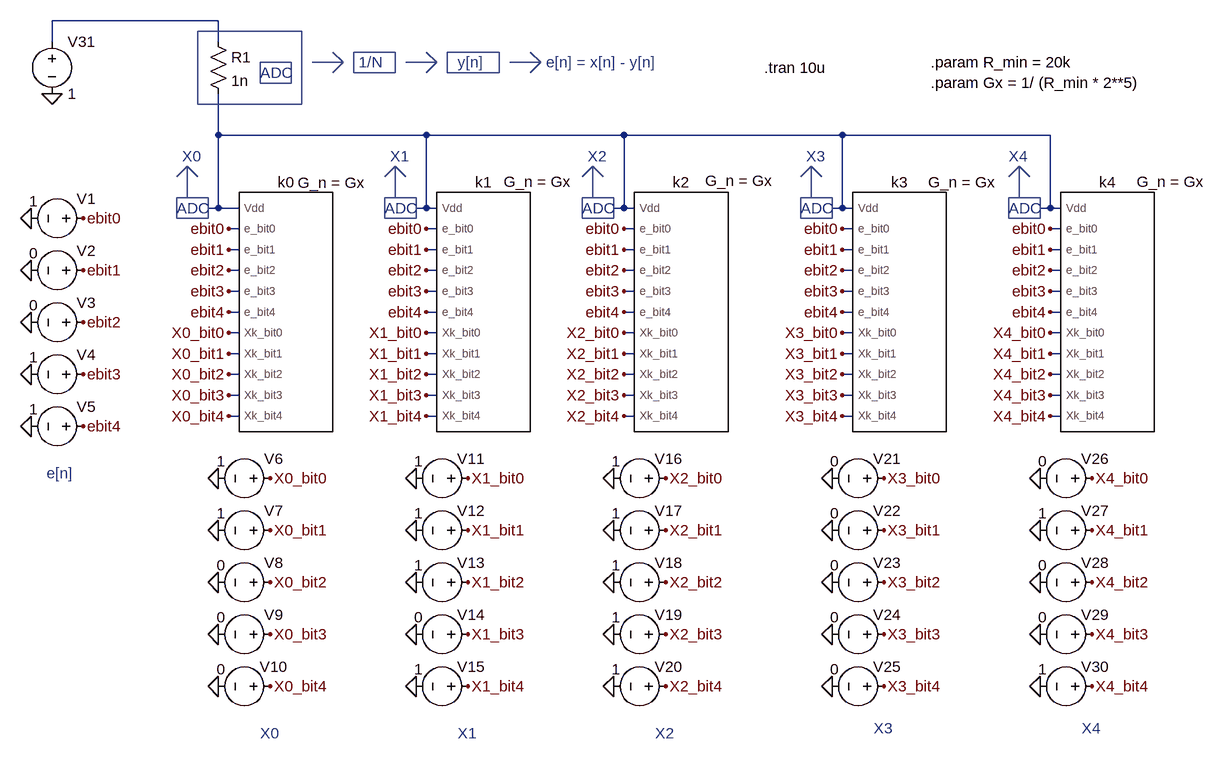
[diagram p0: schematic main.asc]
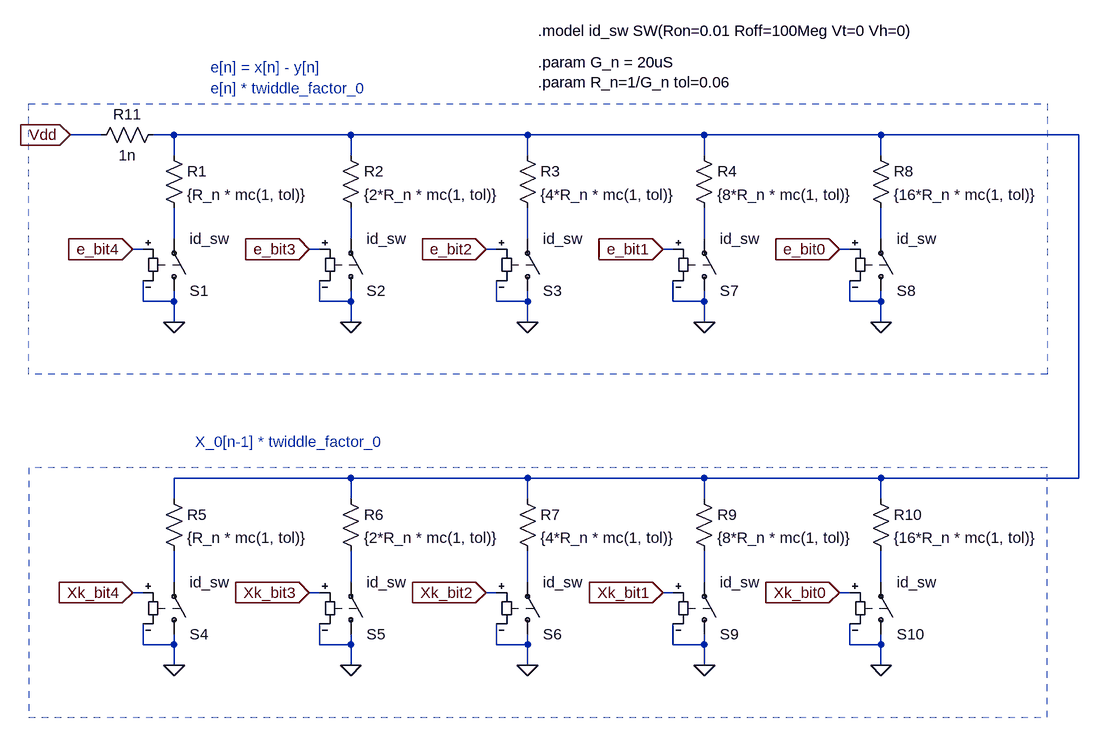
[diagram p1: sub-circuit branch_k.asc]
main.asc, the LTspice schematic file:
Version 4.1
SHEET 1 1732 904
WIRE 176 -208 -80 -208
WIRE -80 -176 -80 -208
WIRE 176 -176 176 -208
WIRE 176 -32 176 -96
WIRE 496 -32 176 -32
WIRE 800 -32 496 -32
WIRE 1136 -32 800 -32
WIRE 1456 -32 1136 -32
WIRE 176 80 176 -32
WIRE 176 80 160 80
WIRE 208 80 176 80
WIRE 496 80 496 -32
WIRE 496 80 480 80
WIRE 512 80 496 80
WIRE 800 80 800 -32
WIRE 800 80 784 80
WIRE 816 80 800 80
WIRE 1136 80 1136 -32
WIRE 1136 80 1120 80
WIRE 1152 80 1136 80
WIRE 1456 80 1456 -32
WIRE 1456 80 1440 80
WIRE 1472 80 1456 80
WIRE 208 112 192 112
WIRE 512 112 496 112
WIRE 816 112 800 112
WIRE 1152 112 1136 112
WIRE 1472 112 1456 112
WIRE 208 144 192 144
WIRE 512 144 496 144
WIRE 816 144 800 144
WIRE 1152 144 1136 144
WIRE 1472 144 1456 144
WIRE 208 176 192 176
WIRE 512 176 496 176
WIRE 816 176 800 176
WIRE 1152 176 1136 176
WIRE 1472 176 1456 176
WIRE 208 208 192 208
WIRE 512 208 496 208
WIRE 816 208 800 208
WIRE 1152 208 1136 208
WIRE 1472 208 1456 208
WIRE 208 240 192 240
WIRE 512 240 496 240
WIRE 816 240 800 240
WIRE 1152 240 1136 240
WIRE 1472 240 1456 240
WIRE 208 272 192 272
WIRE 512 272 496 272
WIRE 816 272 800 272
WIRE 1152 272 1136 272
WIRE 1472 272 1456 272
WIRE 208 304 192 304
WIRE 512 304 496 304
WIRE 816 304 800 304
WIRE 1152 304 1136 304
WIRE 1472 304 1456 304
WIRE 208 336 192 336
WIRE 512 336 496 336
WIRE 816 336 800 336
WIRE 1152 336 1136 336
WIRE 1472 336 1456 336
WIRE 208 368 192 368
WIRE 512 368 496 368
WIRE 816 368 800 368
WIRE 1152 368 1136 368
WIRE 1472 368 1456 368
WIRE 208 400 192 400
WIRE 512 400 496 400
WIRE 816 400 800 400
WIRE 1152 400 1136 400
WIRE 1472 400 1456 400
FLAG -112 96 0
FLAG -112 176 0
FLAG -112 256 0
FLAG -112 336 0
FLAG -112 416 0
FLAG 176 496 0
FLAG 176 576 0
FLAG 176 656 0
FLAG 176 736 0
FLAG 176 816 0
FLAG -32 96 ebit0
FLAG -32 176 ebit1
FLAG -32 256 ebit2
FLAG -32 336 ebit3
FLAG -32 416 ebit4
FLAG 256 496 X0_bit0
FLAG 256 576 X0_bit1
FLAG 256 656 X0_bit2
FLAG 256 736 X0_bit3
FLAG 256 816 X0_bit4
FLAG 480 496 0
FLAG 480 576 0
FLAG 480 656 0
FLAG 480 736 0
FLAG 480 816 0
FLAG 560 496 X1_bit0
FLAG 560 576 X1_bit1
FLAG 560 656 X1_bit2
FLAG 560 736 X1_bit3
FLAG 560 816 X1_bit4
FLAG 784 496 0
FLAG 784 576 0
FLAG 784 656 0
FLAG 784 736 0
FLAG 784 816 0
FLAG 864 496 X2_bit0
FLAG 864 576 X2_bit1
FLAG 864 656 X2_bit2
FLAG 864 736 X2_bit3
FLAG 864 816 X2_bit4
FLAG 1120 496 0
FLAG 1120 576 0
FLAG 1120 656 0
FLAG 1120 736 0
FLAG 1120 816 0
FLAG 1200 496 X3_bit0
FLAG 1200 576 X3_bit1
FLAG 1200 656 X3_bit2
FLAG 1200 736 X3_bit3
FLAG 1200 816 X3_bit4
FLAG 1440 496 0
FLAG 1440 576 0
FLAG 1440 656 0
FLAG 1440 736 0
FLAG 1440 816 0
FLAG 1520 496 X4_bit0
FLAG 1520 576 X4_bit1
FLAG 1520 656 X4_bit2
FLAG 1520 736 X4_bit3
FLAG 1520 816 X4_bit4
FLAG 192 272 X0_bit0
FLAG 192 304 X0_bit1
FLAG 192 336 X0_bit2
FLAG 192 368 X0_bit3
FLAG 192 400 X0_bit4
FLAG 496 272 X1_bit0
FLAG 496 304 X1_bit1
FLAG 496 336 X1_bit2
FLAG 496 368 X1_bit3
FLAG 496 400 X1_bit4
FLAG 800 272 X2_bit0
FLAG 800 304 X2_bit1
FLAG 800 336 X2_bit2
FLAG 800 368 X2_bit3
FLAG 800 400 X2_bit4
FLAG 1136 272 X3_bit0
FLAG 1136 304 X3_bit1
FLAG 1136 336 X3_bit2
FLAG 1136 368 X3_bit3
FLAG 1136 400 X3_bit4
FLAG 1456 272 X4_bit0
FLAG 1456 304 X4_bit1
FLAG 1456 336 X4_bit2
FLAG 1456 368 X4_bit3
FLAG 1456 400 X4_bit4
FLAG 192 112 ebit0
FLAG 192 144 ebit1
FLAG 192 176 ebit2
FLAG 192 208 ebit3
FLAG 192 240 ebit4
FLAG 496 112 ebit0
FLAG 496 144 ebit1
FLAG 496 176 ebit2
FLAG 496 208 ebit3
FLAG 496 240 ebit4
FLAG 800 112 ebit0
FLAG 800 144 ebit1
FLAG 800 176 ebit2
FLAG 800 208 ebit3
FLAG 800 240 ebit4
FLAG 1136 112 ebit0
FLAG 1136 144 ebit1
FLAG 1136 176 ebit2
FLAG 1136 208 ebit3
FLAG 1136 240 ebit4
FLAG 1456 112 ebit0
FLAG 1456 144 ebit1
FLAG 1456 176 ebit2
FLAG 1456 208 ebit3
FLAG 1456 240 ebit4
FLAG -80 -96 0
SYMBOL branch_k 272 240 R0
WINDOW 39 78 -183 Bottom 2
SYMATTR SpiceLine G_n = Gx
SYMATTR InstName k0
SYMBOL branch_k 576 240 R0
WINDOW 39 91 -185 Bottom 2
SYMATTR SpiceLine G_n = Gx
SYMATTR InstName k1
SYMBOL branch_k 880 240 R0
WINDOW 39 97 -186 Bottom 2
SYMATTR SpiceLine G_n = Gx
SYMATTR InstName k2
SYMBOL branch_k 1216 240 R0
WINDOW 39 104 -184 Bottom 2
SYMATTR SpiceLine G_n = Gx
SYMATTR InstName k3
SYMBOL branch_k 1536 240 R0
WINDOW 39 105 -185 Bottom 2
SYMATTR SpiceLine G_n = Gx
SYMATTR InstName k4
SYMBOL voltage -16 96 R90
WINDOW 0 -15 11 VBottom 2
WINDOW 3 -42 92 VTop 2
WINDOW 123 0 0 Left 0
WINDOW 39 0 0 Left 0
SYMATTR InstName V1
SYMATTR Value 1
SYMBOL voltage -16 176 R90
WINDOW 0 -15 11 VBottom 2
WINDOW 3 -42 92 VTop 2
WINDOW 123 0 0 Left 0
WINDOW 39 0 0 Left 0
SYMATTR InstName V2
SYMATTR Value 0
SYMBOL voltage -16 256 R90
WINDOW 0 -15 11 VBottom 2
WINDOW 3 -42 92 VTop 2
WINDOW 123 0 0 Left 0
WINDOW 39 0 0 Left 0
SYMATTR InstName V3
SYMATTR Value 0
SYMBOL voltage -16 336 R90
WINDOW 0 -15 11 VBottom 2
WINDOW 3 -42 92 VTop 2
WINDOW 123 0 0 Left 0
WINDOW 39 0 0 Left 0
SYMATTR InstName V4
SYMATTR Value 1
SYMBOL voltage -16 416 R90
WINDOW 0 -15 11 VBottom 2
WINDOW 3 -42 92 VTop 2
WINDOW 123 0 0 Left 0
WINDOW 39 0 0 Left 0
SYMATTR InstName V5
SYMATTR Value 1
SYMBOL voltage 272 496 R90
WINDOW 0 -15 11 VBottom 2
WINDOW 3 -42 92 VTop 2
WINDOW 123 0 0 Left 0
WINDOW 39 0 0 Left 0
SYMATTR InstName V6
SYMATTR Value 1
SYMBOL voltage 272 576 R90
WINDOW 0 -15 11 VBottom 2
WINDOW 3 -42 92 VTop 2
WINDOW 123 0 0 Left 0
WINDOW 39 0 0 Left 0
SYMATTR InstName V7
SYMATTR Value 1
SYMBOL voltage 272 656 R90
WINDOW 0 -15 11 VBottom 2
WINDOW 3 -42 92 VTop 2
WINDOW 123 0 0 Left 0
WINDOW 39 0 0 Left 0
SYMATTR InstName V8
SYMATTR Value 0
SYMBOL voltage 272 736 R90
WINDOW 0 -15 11 VBottom 2
WINDOW 3 -42 92 VTop 2
WINDOW 123 0 0 Left 0
WINDOW 39 0 0 Left 0
SYMATTR InstName V9
SYMATTR Value 0
SYMBOL voltage 272 816 R90
WINDOW 0 -15 11 VBottom 2
WINDOW 3 -42 92 VTop 2
WINDOW 123 0 0 Left 0
WINDOW 39 0 0 Left 0
SYMATTR InstName V10
SYMATTR Value 0
SYMBOL voltage 576 496 R90
WINDOW 0 -15 11 VBottom 2
WINDOW 3 -42 92 VTop 2
WINDOW 123 0 0 Left 0
WINDOW 39 0 0 Left 0
SYMATTR InstName V11
SYMATTR Value 1
SYMBOL voltage 576 576 R90
WINDOW 0 -15 11 VBottom 2
WINDOW 3 -42 92 VTop 2
WINDOW 123 0 0 Left 0
WINDOW 39 0 0 Left 0
SYMATTR InstName V12
SYMATTR Value 1
SYMBOL voltage 576 656 R90
WINDOW 0 -15 11 VBottom 2
WINDOW 3 -42 92 VTop 2
WINDOW 123 0 0 Left 0
WINDOW 39 0 0 Left 0
SYMATTR InstName V13
SYMATTR Value 1
SYMBOL voltage 576 736 R90
WINDOW 0 -15 11 VBottom 2
WINDOW 3 -42 92 VTop 2
WINDOW 123 0 0 Left 0
WINDOW 39 0 0 Left 0
SYMATTR InstName V14
SYMATTR Value 0
SYMBOL voltage 576 816 R90
WINDOW 0 -15 11 VBottom 2
WINDOW 3 -42 92 VTop 2
WINDOW 123 0 0 Left 0
WINDOW 39 0 0 Left 0
SYMATTR InstName V15
SYMATTR Value 1
SYMBOL voltage 880 496 R90
WINDOW 0 -15 11 VBottom 2
WINDOW 3 -42 92 VTop 2
WINDOW 123 0 0 Left 0
WINDOW 39 0 0 Left 0
SYMATTR InstName V16
SYMATTR Value 1
SYMBOL voltage 880 576 R90
WINDOW 0 -15 11 VBottom 2
WINDOW 3 -42 92 VTop 2
WINDOW 123 0 0 Left 0
WINDOW 39 0 0 Left 0
SYMATTR InstName V17
SYMATTR Value 1
SYMBOL voltage 880 656 R90
WINDOW 0 -15 11 VBottom 2
WINDOW 3 -42 92 VTop 2
WINDOW 123 0 0 Left 0
WINDOW 39 0 0 Left 0
SYMATTR InstName V18
SYMATTR Value 1
SYMBOL voltage 880 736 R90
WINDOW 0 -15 11 VBottom 2
WINDOW 3 -42 92 VTop 2
WINDOW 123 0 0 Left 0
WINDOW 39 0 0 Left 0
SYMATTR InstName V19
SYMATTR Value 1
SYMBOL voltage 880 816 R90
WINDOW 0 -15 11 VBottom 2
WINDOW 3 -42 92 VTop 2
WINDOW 123 0 0 Left 0
WINDOW 39 0 0 Left 0
SYMATTR InstName V20
SYMATTR Value 1
SYMBOL voltage 1216 496 R90
WINDOW 0 -15 11 VBottom 2
WINDOW 3 -42 92 VTop 2
WINDOW 123 0 0 Left 0
WINDOW 39 0 0 Left 0
SYMATTR InstName V21
SYMATTR Value 0
SYMBOL voltage 1216 576 R90
WINDOW 0 -15 11 VBottom 2
WINDOW 3 -42 92 VTop 2
WINDOW 123 0 0 Left 0
WINDOW 39 0 0 Left 0
SYMATTR InstName V22
SYMATTR Value 0
SYMBOL voltage 1216 656 R90
WINDOW 0 -15 11 VBottom 2
WINDOW 3 -42 92 VTop 2
WINDOW 123 0 0 Left 0
WINDOW 39 0 0 Left 0
SYMATTR InstName V23
SYMATTR Value 0
SYMBOL voltage 1216 736 R90
WINDOW 0 -15 11 VBottom 2
WINDOW 3 -42 92 VTop 2
WINDOW 123 0 0 Left 0
WINDOW 39 0 0 Left 0
SYMATTR InstName V24
SYMATTR Value 0
SYMBOL voltage 1216 816 R90
WINDOW 0 -15 11 VBottom 2
WINDOW 3 -42 92 VTop 2
WINDOW 123 0 0 Left 0
WINDOW 39 0 0 Left 0
SYMATTR InstName V25
SYMATTR Value 0
SYMBOL voltage 1536 496 R90
WINDOW 0 -15 11 VBottom 2
WINDOW 3 -42 92 VTop 2
WINDOW 123 0 0 Left 0
WINDOW 39 0 0 Left 0
SYMATTR InstName V26
SYMATTR Value 0
SYMBOL voltage 1536 576 R90
WINDOW 0 -15 11 VBottom 2
WINDOW 3 -42 92 VTop 2
WINDOW 123 0 0 Left 0
WINDOW 39 0 0 Left 0
SYMATTR InstName V27
SYMATTR Value 1
SYMBOL voltage 1536 656 R90
WINDOW 0 -15 11 VBottom 2
WINDOW 3 -42 92 VTop 2
WINDOW 123 0 0 Left 0
WINDOW 39 0 0 Left 0
SYMATTR InstName V28
SYMATTR Value 0
SYMBOL voltage 1536 736 R90
WINDOW 0 -15 11 VBottom 2
WINDOW 3 -42 92 VTop 2
WINDOW 123 0 0 Left 0
WINDOW 39 0 0 Left 0
SYMATTR InstName V29
SYMATTR Value 0
SYMBOL voltage 1536 816 R90
WINDOW 0 -15 11 VBottom 2
WINDOW 3 -42 92 VTop 2
WINDOW 123 0 0 Left 0
WINDOW 39 0 0 Left 0
SYMATTR InstName V30
SYMATTR Value 1
SYMBOL voltage -80 -192 R0
WINDOW 123 0 0 Left 0
WINDOW 39 0 0 Left 0
SYMATTR InstName V31
SYMATTR Value 1
SYMBOL res 160 -192 R0
SYMATTR InstName R1
SYMATTR Value 1n
TEXT 112 80 Left 2 ;ADC
TEXT 120 0 Left 2 ;X0
TEXT 440 0 Left 2 ;X1
TEXT 744 0 Left 2 ;X2
TEXT 1080 0 Left 2 ;X3
TEXT 1392 0 Left 2 ;X4
TEXT 432 80 Left 2 ;ADC
TEXT 736 80 Left 2 ;ADC
TEXT 1072 80 Left 2 ;ADC
TEXT 1392 80 Left 2 ;ADC
TEXT 240 -128 Left 2 ;ADC
TEXT 392 -144 Left 2 ;1/N
TEXT 544 -144 Left 2 ;y[n]
TEXT 680 -144 Left 2 ;e[n] = x[n] - y[n]
TEXT 1016 -136 Left 2 !.tran 10u
TEXT 240 888 Left 2 ;X0
TEXT 544 888 Left 2 ;X1
TEXT 848 888 Left 2 ;X2
TEXT 1184 880 Left 2 ;X3
TEXT 1504 880 Left 2 ;X4
TEXT -88 488 Left 2 ;e[n]
TEXT 1272 -144 Left 2 !.param R_min = 20k\n.param Gx = 1/ (R_min * 2**5)
LINE Normal 128 16 128 64
LINE Normal 144 32 128 16
LINE Normal 128 16 144 32
LINE Normal 112 32 128 16
LINE Normal 448 16 448 64
LINE Normal 464 32 448 16
LINE Normal 448 16 464 32
LINE Normal 432 32 448 16
LINE Normal 752 16 752 64
LINE Normal 768 32 752 16
LINE Normal 752 16 768 32
LINE Normal 736 32 752 16
LINE Normal 1088 16 1088 64
LINE Normal 1104 32 1088 16
LINE Normal 1088 16 1104 32
LINE Normal 1072 32 1088 16
LINE Normal 1408 16 1408 64
LINE Normal 1424 32 1408 16
LINE Normal 1408 16 1424 32
LINE Normal 1392 32 1408 16
LINE Normal 368 -144 320 -144
LINE Normal 352 -128 368 -144
LINE Normal 368 -144 352 -128
LINE Normal 352 -160 368 -144
LINE Normal 512 -144 464 -144
LINE Normal 496 -128 512 -144
LINE Normal 512 -144 496 -128
LINE Normal 496 -160 512 -144
LINE Normal 672 -144 624 -144
LINE Normal 656 -128 672 -144
LINE Normal 672 -144 656 -128
LINE Normal 656 -160 672 -144
RECTANGLE Normal 160 96 112 64
RECTANGLE Normal 480 96 432 64
RECTANGLE Normal 784 96 736 64
RECTANGLE Normal 1120 96 1072 64
RECTANGLE Normal 1440 96 1392 64
RECTANGLE Normal 288 -112 240 -144
RECTANGLE Normal 304 -192 144 -80
RECTANGLE Normal 448 -128 384 -160
RECTANGLE Normal 608 -128 528 -160

branch_k.asc, the sub-circuit schematic file:
Version 4.1
SHEET 1 1796 1140
WIRE -320 -224 -368 -224
WIRE -208 -224 -240 -224
WIRE 64 -224 -208 -224
WIRE 336 -224 64 -224
WIRE 608 -224 336 -224
WIRE 880 -224 608 -224
WIRE 1184 -224 880 -224
WIRE -208 -192 -208 -224
WIRE 64 -192 64 -224
WIRE 336 -192 336 -224
WIRE 608 -192 608 -224
WIRE 880 -192 880 -224
WIRE -208 -64 -208 -112
WIRE 64 -64 64 -112
WIRE 336 -64 336 -112
WIRE 608 -64 608 -112
WIRE 880 -64 880 -112
WIRE -256 -48 -272 -48
WIRE 16 -48 0 -48
WIRE 288 -48 272 -48
WIRE 560 -48 544 -48
WIRE 832 -48 816 -48
WIRE -256 32 -256 0
WIRE -208 32 -208 16
WIRE -208 32 -256 32
WIRE 16 32 16 0
WIRE 64 32 64 16
WIRE 64 32 16 32
WIRE 288 32 288 0
WIRE 336 32 336 16
WIRE 336 32 288 32
WIRE 560 32 560 0
WIRE 608 32 608 16
WIRE 608 32 560 32
WIRE 832 32 832 0
WIRE 880 32 880 16
WIRE 880 32 832 32
WIRE -208 64 -208 32
WIRE 64 64 64 32
WIRE 336 64 336 32
WIRE 608 64 608 32
WIRE 880 64 880 32
WIRE 64 304 -208 304
WIRE 336 304 64 304
WIRE 608 304 336 304
WIRE 880 304 608 304
WIRE 1184 304 1184 -224
WIRE 1184 304 880 304
WIRE -208 336 -208 304
WIRE 64 336 64 304
WIRE 336 336 336 304
WIRE 608 336 608 304
WIRE 880 336 880 304
WIRE -208 464 -208 416
WIRE 64 464 64 416
WIRE 336 464 336 416
WIRE 608 464 608 416
WIRE 880 464 880 416
WIRE -256 480 -272 480
WIRE 16 480 0 480
WIRE 288 480 272 480
WIRE 560 480 544 480
WIRE 832 480 816 480
WIRE -256 560 -256 528
WIRE -208 560 -208 544
WIRE -208 560 -256 560
WIRE 16 560 16 528
WIRE 64 560 64 544
WIRE 64 560 16 560
WIRE 288 560 288 528
WIRE 336 560 336 544
WIRE 336 560 288 560
WIRE 560 560 560 528
WIRE 608 560 608 544
WIRE 608 560 560 560
WIRE 832 560 832 528
WIRE 880 560 880 544
WIRE 880 560 832 560
WIRE -208 592 -208 560
WIRE 64 592 64 560
WIRE 336 592 336 560
WIRE 608 592 608 560
WIRE 880 592 880 560
FLAG -208 64 0
FLAG 64 64 0
FLAG 336 64 0
FLAG -208 592 0
FLAG 64 592 0
FLAG 336 592 0
FLAG 608 64 0
FLAG 880 64 0
FLAG 608 592 0
FLAG 880 592 0
FLAG -368 -224 Vdd
IOPIN -368 -224 In
FLAG -272 -48 e_bit4
IOPIN -272 -48 In
FLAG 0 -48 e_bit3
IOPIN 0 -48 In
FLAG 272 -48 e_bit2
IOPIN 272 -48 In
FLAG 544 -48 e_bit1
IOPIN 544 -48 In
FLAG 816 -48 e_bit0
IOPIN 816 -48 In
FLAG -272 480 Xk_bit4
IOPIN -272 480 In
FLAG 0 480 Xk_bit3
IOPIN 0 480 In
FLAG 272 480 Xk_bit2
IOPIN 272 480 In
FLAG 544 480 Xk_bit1
IOPIN 544 480 In
FLAG 816 480 Xk_bit0
IOPIN 816 480 In
SYMBOL res -224 -208 R0
SYMATTR InstName R1
SYMATTR Value {R_n * mc(1, tol)}
SYMBOL res 48 -208 R0
SYMATTR InstName R2
SYMATTR Value {2*R_n * mc(1, tol)}
SYMBOL res 320 -208 R0
SYMATTR InstName R3
SYMATTR Value {4*R_n * mc(1, tol)}
SYMBOL sw -208 32 M180
SYMATTR InstName S1
SYMATTR Value id_sw
SYMBOL sw 64 32 M180
SYMATTR InstName S2
SYMATTR Value id_sw
SYMBOL sw 336 32 M180
SYMATTR InstName S3
SYMATTR Value id_sw
SYMBOL res -224 -240 R90
WINDOW 0 0 56 VBottom 2
WINDOW 3 32 56 VTop 2
SYMATTR InstName R11
SYMATTR Value 1n
SYMBOL sw -208 560 M180
SYMATTR InstName S4
SYMATTR Value id_sw
SYMBOL sw 64 560 M180
SYMATTR InstName S5
SYMATTR Value id_sw
SYMBOL sw 336 560 M180
SYMATTR InstName S6
SYMATTR Value id_sw
SYMBOL res -224 320 R0
SYMATTR InstName R5
SYMATTR Value {R_n * mc(1, tol)}
SYMBOL res 48 320 R0
SYMATTR InstName R6
SYMATTR Value {2*R_n * mc(1, tol)}
SYMBOL res 320 320 R0
SYMATTR InstName R7
SYMATTR Value {4*R_n * mc(1, tol)}
SYMBOL res 592 -208 R0
SYMATTR InstName R4
SYMATTR Value {8*R_n * mc(1, tol)}
SYMBOL sw 608 32 M180
SYMATTR InstName S7
SYMATTR Value id_sw
SYMBOL res 864 -208 R0
SYMATTR InstName R8
SYMATTR Value {16*R_n * mc(1, tol)}
SYMBOL sw 880 32 M180
SYMATTR InstName S8
SYMATTR Value id_sw
SYMBOL sw 608 560 M180
SYMATTR InstName S9
SYMATTR Value id_sw
SYMBOL res 592 320 R0
SYMATTR InstName R9
SYMATTR Value {8*R_n * mc(1, tol)}
SYMBOL sw 880 560 M180
SYMATTR InstName S10
SYMATTR Value id_sw
SYMBOL res 864 320 R0
SYMATTR InstName R10
SYMATTR Value {16*R_n * mc(1, tol)}
TEXT 352 -384 Left 2 !.model id_sw SW(Ron=0.01 Roff=100Meg Vt=0 Vh=0)
TEXT 352 -336 Left 2 !.param G_n = 20uS\n.param R_n=1/G_n tol=0.06
TEXT -152 -328 Left 2 ;e[n] = x[n] - y[n]
TEXT -152 -296 Left 2 ;e[n] * twiddle_factor_0
TEXT -176 248 Left 2 ;X_0[n-1] * twiddle_factor_0
RECTANGLE Normal 1136 144 -432 -272 2
RECTANGLE Normal -432 672 1136 288 2

The netlist it stands for:
* main.asc
X§k0 ebit0 ebit1 ebit2 ebit3 ebit4 N002 X0_bit0 X0_bit1 X0_bit2 X0_bit3 X0_bit4 branch_k params: G_n = Gx
X§k1 ebit0 ebit1 ebit2 ebit3 ebit4 N002 X1_bit0 X1_bit1 X1_bit2 X1_bit3 X1_bit4 branch_k params: G_n = Gx
X§k2 ebit0 ebit1 ebit2 ebit3 ebit4 N002 X2_bit0 X2_bit1 X2_bit2 X2_bit3 X2_bit4 branch_k params: G_n = Gx
X§k3 ebit0 ebit1 ebit2 ebit3 ebit4 N002 X3_bit0 X3_bit1 X3_bit2 X3_bit3 X3_bit4 branch_k params: G_n = Gx
X§k4 ebit0 ebit1 ebit2 ebit3 ebit4 N002 X4_bit0 X4_bit1 X4_bit2 X4_bit3 X4_bit4 branch_k params: G_n = Gx
V1 ebit0 0 1
V2 ebit1 0 0
V3 ebit2 0 0
V4 ebit3 0 1
V5 ebit4 0 1
V6 X0_bit0 0 1
V7 X0_bit1 0 1
V8 X0_bit2 0 0
V9 X0_bit3 0 0
V10 X0_bit4 0 0
V11 X1_bit0 0 1
V12 X1_bit1 0 1
V13 X1_bit2 0 1
V14 X1_bit3 0 0
V15 X1_bit4 0 1
V16 X2_bit0 0 1
V17 X2_bit1 0 1
V18 X2_bit2 0 1
V19 X2_bit3 0 1
V20 X2_bit4 0 1
V21 X3_bit0 0 0
V22 X3_bit1 0 0
V23 X3_bit2 0 0
V24 X3_bit3 0 0
V25 X3_bit4 0 0
V26 X4_bit0 0 0
V27 X4_bit1 0 1
V28 X4_bit2 0 0
V29 X4_bit3 0 0
V30 X4_bit4 0 1
V31 N001 0 1
R1 N001 N002 1n

* block symbol definitions
.subckt branch_k e_bit0 e_bit1 e_bit2 e_bit3 e_bit4 Vdd Xk_bit0 Xk_bit1 Xk_bit2 Xk_bit3 Xk_bit4
R1 N001 N002 {R_n * mc(1, tol)}
R2 N001 N003 {2*R_n * mc(1, tol)}
R3 N001 N004 {4*R_n * mc(1, tol)}
S1 0 N002 e_bit4 0 id_sw
S2 0 N003 e_bit3 0 id_sw
S3 0 N004 e_bit2 0 id_sw
R11 N001 Vdd 1n
S4 0 N007 Xk_bit4 0 id_sw
S5 0 N008 Xk_bit3 0 id_sw
S6 0 N009 Xk_bit2 0 id_sw
R5 N001 N007 {R_n * mc(1, tol)}
R6 N001 N008 {2*R_n * mc(1, tol)}
R7 N001 N009 {4*R_n * mc(1, tol)}
R4 N001 N005 {8*R_n * mc(1, tol)}
S7 0 N005 e_bit1 0 id_sw
R8 N001 N006 {16*R_n * mc(1, tol)}
S8 0 N006 e_bit0 0 id_sw
S9 0 N010 Xk_bit1 0 id_sw
R9 N001 N010 {8*R_n * mc(1, tol)}
S10 0 N011 Xk_bit0 0 id_sw
R10 N001 N011 {16*R_n * mc(1, tol)}
.model id_sw SW(Ron=0.01 Roff=100Meg Vt=0 Vh=0)
.param G_n = 20uS
.param R_n=1/G_n tol=0.06
* e[n] = x[n] - y[n]
* e[n] * twiddle_factor_0
* X_0[n-1] * twiddle_factor_0
.ends branch_k

* ADC
* X0
* X1
* X2
* X3
* X4
* ADC
* ADC
* ADC
* ADC
* ADC
* 1/N
* y[n]
* e[n] = x[n] - y[n]
.tran 10u
* X0
* X1
* X2
* X3
* X4
* e[n]
.param R_min = 20k
.param Gx = 1/ (R_min * 2**5)
.backanno
.end